# Altium schematic sheet FPGA_Banks_and_Filters.SchDoc
size A4; SheetNumber: 10; SheetTotal: 13
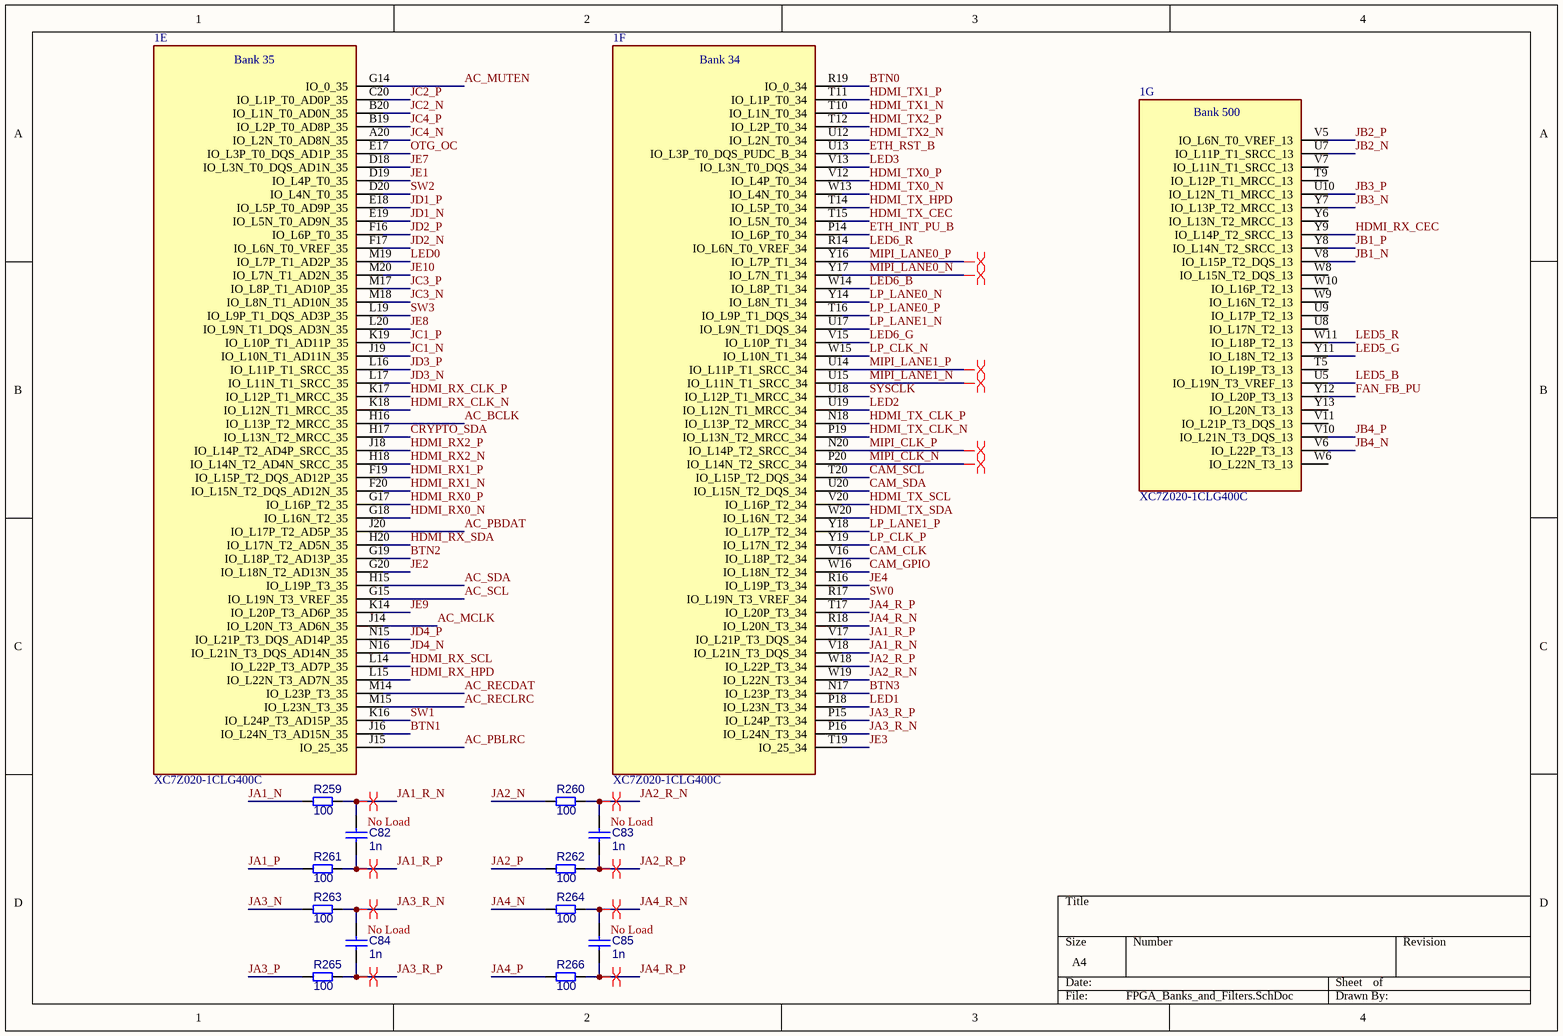
[diagram p0: FPGA_Banks_and_Filters.SchDoc]

## Parts
1  XC7Z020-1CLG400C  [BGA400C80P20X20_1700X1700X160]  (parts E,F,G of 9)
C82  1n  [CAPC1005X50N_0402]
C83  1n  [CAPC1005X50N_0402]
C84  1n  [CAPC1005X50N_0402]
C85  1n  [CAPC1005X50N_0402]
R259  100  [R_0402]
R260  100  [R_0402]
R261  100  [R_0402]
R262  100  [R_0402]
R263  100  [R_0402]
R264  100  [R_0402]
R265  100  [R_0402]
R266  100  [R_0402]

## Nets
AC_BCLK: 1.H16(IO_L13P_T2_MRCC_35)
AC_MCLK: 1.J14(IO_L20N_T3_AD6N_35)
AC_MUTEN: 1.G14(IO_0_35)
AC_PBDAT: 1.J20(IO_L17P_T2_AD5P_35)
AC_PBLRC: 1.J15(IO_25_35)
AC_RECDAT: 1.M14(IO_L23P_T3_35)
AC_RECLRC: 1.M15(IO_L23N_T3_35)
AC_SCL: 1.G15(IO_L19N_T3_VREF_35)
AC_SDA: 1.H15(IO_L19P_T3_35)
BTN0: 1.R19(IO_0_34)
BTN1: 1.J16(IO_L24N_T3_AD15N_35)
BTN2: 1.G19(IO_L18P_T2_AD13P_35)
BTN3: 1.N17(IO_L23P_T3_34)
CAM_CLK: 1.V16(IO_L18P_T2_34)
CAM_GPIO: 1.W16(IO_L18N_T2_34)
CAM_SCL: 1.T20(IO_L15P_T2_DQS_34)
CAM_SDA: 1.U20(IO_L15N_T2_DQS_34)
CRYPTO_SDA: 1.H17(IO_L13N_T2_MRCC_35)
ETH_INT_PU_B: 1.P14(IO_L6P_T0_34)
ETH_RST_B: 1.U13(IO_L3P_T0_DQS_PUDC_B_34)
FAN_FB_PU: 1.Y12(IO_L20P_T3_13)
HDMI_RX0_N: 1.G18(IO_L16N_T2_35)
HDMI_RX0_P: 1.G17(IO_L16P_T2_35)
HDMI_RX1_N: 1.F20(IO_L15N_T2_DQS_AD12N_35)
HDMI_RX1_P: 1.F19(IO_L15P_T2_DQS_AD12P_35)
HDMI_RX2_N: 1.H18(IO_L14N_T2_AD4N_SRCC_35)
HDMI_RX2_P: 1.J18(IO_L14P_T2_AD4P_SRCC_35)
HDMI_RX_CEC: 1.Y9(IO_L14P_T2_SRCC_13)
HDMI_RX_CLK_N: 1.K18(IO_L12N_T1_MRCC_35)
HDMI_RX_CLK_P: 1.K17(IO_L12P_T1_MRCC_35)
HDMI_RX_HPD: 1.L15(IO_L22N_T3_AD7N_35)
HDMI_RX_SCL: 1.L14(IO_L22P_T3_AD7P_35)
HDMI_RX_SDA: 1.H20(IO_L17N_T2_AD5N_35)
HDMI_TX0_N: 1.W13(IO_L4N_T0_34)
HDMI_TX0_P: 1.V12(IO_L4P_T0_34)
HDMI_TX1_N: 1.T10(IO_L1N_T0_34)
HDMI_TX1_P: 1.T11(IO_L1P_T0_34)
HDMI_TX2_N: 1.U12(IO_L2N_T0_34)
HDMI_TX2_P: 1.T12(IO_L2P_T0_34)
HDMI_TX_CEC: 1.T15(IO_L5N_T0_34)
HDMI_TX_CLK_N: 1.P19(IO_L13N_T2_MRCC_34)
HDMI_TX_CLK_P: 1.N18(IO_L13P_T2_MRCC_34)
HDMI_TX_HPD: 1.T14(IO_L5P_T0_34)
HDMI_TX_SCL: 1.V20(IO_L16P_T2_34)
HDMI_TX_SDA: 1.W20(IO_L16N_T2_34)
JA1_N: R259.1
JA1_P: R261.1
JA1_R_N: 1.V18(IO_L21N_T3_DQS_34) C82.2 R259.2
JA1_R_P: 1.V17(IO_L21P_T3_DQS_34) C82.1 R261.2
JA2_N: R260.1
JA2_P: R262.1
JA2_R_N: 1.W19(IO_L22N_T3_34) C83.2 R260.2
JA2_R_P: 1.W18(IO_L22P_T3_34) C83.1 R262.2
JA3_N: R263.1
JA3_P: R265.1
JA3_R_N: 1.P16(IO_L24N_T3_34) C84.2 R263.2
JA3_R_P: 1.P15(IO_L24P_T3_34) C84.1 R265.2
JA4_N: R264.1
JA4_P: R266.1
JA4_R_N: 1.R18(IO_L20N_T3_34) C85.2 R264.2
JA4_R_P: 1.T17(IO_L20P_T3_34) C85.1 R266.2
JB1_N: 1.V8(IO_L15P_T2_DQS_13)
JB1_P: 1.Y8(IO_L14N_T2_SRCC_13)
JB2_N: 1.U7(IO_L11P_T1_SRCC_13)
JB2_P: 1.V5(IO_L6N_T0_VREF_13)
JB3_N: 1.Y7(IO_L13P_T2_MRCC_13)
JB3_P: 1.U10(IO_L12N_T1_MRCC_13)
JB4_N: 1.V6(IO_L22P_T3_13)
JB4_P: 1.V10(IO_L21N_T3_DQS_13)
JC1_N: 1.J19(IO_L10N_T1_AD11N_35)
JC1_P: 1.K19(IO_L10P_T1_AD11P_35)
JC2_N: 1.B20(IO_L1N_T0_AD0N_35)
JC2_P: 1.C20(IO_L1P_T0_AD0P_35)
JC3_N: 1.M18(IO_L8N_T1_AD10N_35)
JC3_P: 1.M17(IO_L8P_T1_AD10P_35)
JC4_N: 1.A20(IO_L2N_T0_AD8N_35)
JC4_P: 1.B19(IO_L2P_T0_AD8P_35)
JD1_N: 1.E19(IO_L5N_T0_AD9N_35)
JD1_P: 1.E18(IO_L5P_T0_AD9P_35)
JD2_N: 1.F17(IO_L6N_T0_VREF_35)
JD2_P: 1.F16(IO_L6P_T0_35)
JD3_N: 1.L17(IO_L11N_T1_SRCC_35)
JD3_P: 1.L16(IO_L11P_T1_SRCC_35)
JD4_N: 1.N16(IO_L21N_T3_DQS_AD14N_35)
JD4_P: 1.N15(IO_L21P_T3_DQS_AD14P_35)
JE1: 1.D19(IO_L4P_T0_35)
JE2: 1.G20(IO_L18N_T2_AD13N_35)
JE3: 1.T19(IO_25_34)
JE4: 1.R16(IO_L19P_T3_34)
JE7: 1.D18(IO_L3N_T0_DQS_AD1N_35)
JE8: 1.L20(IO_L9N_T1_DQS_AD3N_35)
JE9: 1.K14(IO_L20P_T3_AD6P_35)
JE10: 1.M20(IO_L7N_T1_AD2N_35)
LED0: 1.M19(IO_L7P_T1_AD2P_35)
LED1: 1.P18(IO_L23N_T3_34)
LED2: 1.U19(IO_L12N_T1_MRCC_34)
LED3: 1.V13(IO_L3N_T0_DQS_34)
LED5_B: 1.U5(IO_L19N_T3_VREF_13)
LED5_G: 1.Y11(IO_L18N_T2_13)
LED5_R: 1.W11(IO_L18P_T2_13)
LED6_B: 1.W14(IO_L8P_T1_34)
LED6_G: 1.V15(IO_L10P_T1_34)
LED6_R: 1.R14(IO_L6N_T0_VREF_34)
LP_CLK_N: 1.W15(IO_L10N_T1_34)
LP_CLK_P: 1.Y19(IO_L17N_T2_34)
LP_LANE0_N: 1.Y14(IO_L8N_T1_34)
LP_LANE0_P: 1.T16(IO_L9P_T1_DQS_34)
LP_LANE1_N: 1.U17(IO_L9N_T1_DQS_34)
LP_LANE1_P: 1.Y18(IO_L17P_T2_34)
MIPI_CLK_N: 1.P20(IO_L14N_T2_SRCC_34)
MIPI_CLK_P: 1.N20(IO_L14P_T2_SRCC_34)
MIPI_LANE0_N: 1.Y17(IO_L7N_T1_34)
MIPI_LANE0_P: 1.Y16(IO_L7P_T1_34)
MIPI_LANE1_N: 1.U15(IO_L11N_T1_SRCC_34)
MIPI_LANE1_P: 1.U14(IO_L11P_T1_SRCC_34)
OTG_OC: 1.E17(IO_L3P_T0_DQS_AD1P_35)
SW0: 1.R17(IO_L19N_T3_VREF_34)
SW1: 1.K16(IO_L24P_T3_AD15P_35)
SW2: 1.D20(IO_L4N_T0_35)
SW3: 1.L19(IO_L9P_T1_DQS_AD3P_35)
SYSCLK: 1.U18(IO_L12P_T1_MRCC_34)

Not connected (* = marked no-connect by the designer): 1 T5(IO_L19P_T3_13) T9(IO_L12P_T1_MRCC_13) U8(IO_L17N_T2_13) U9(IO_L17P_T2_13) V7(IO_L11N_T1_SRCC_13) V11(IO_L21P_T3_DQS_13) W6(IO_L22N_T3_13) W8(IO_L15N_T2_DQS_13) W9(IO_L16N_T2_13) W10(IO_L16P_T2_13) Y6(IO_L13N_T2_MRCC_13) Y13(IO_L20N_T3_13)

## Layout directives
differential pair: JA1_R_N, JA1_R_P, JA2_R_N, JA2_R_P, JA3_R_N, JA3_R_P, JA4_R_N, JA4_R_P, MIPI_CLK_N, MIPI_CLK_P, MIPI_LANE0_N, MIPI_LANE0_P, MIPI_LANE1_N, MIPI_LANE1_P

## Notes on the sheet
- (near C82) No Load
- (near C83) No Load
- (near C84) No Load
- (near C85) No Load
- (in symbol XC7Z020-1CLG400C, part E) Bank 35
- (in symbol XC7Z020-1CLG400C, part F) Bank 34
- (in symbol XC7Z020-1CLG400C, part G) Bank 500

## Library data of the parts
1 = XC7Z020-1CLG400C: Integrated Circuit; Manufacturer_Name: AMD; Datasheet Link: http://www.xilinx.com/support/documentation/data_sheets/ds190-Zynq-7000-Overview.pdf; Height: 1.6mm; Manufacturer_Part_Number: XC7Z020-1CLG400C; Mouser Part Number: 217-XC7Z020-1CLG400C; Mouser Price/Stock: https://www.mouser.co.uk/ProductDetail/AMD-Xilinx/XC7Z020-1CLG400C?qs=rrS6PyfT74eaxuOsP%2FGL4g%3D%3D
C82-C85 = CMP-001-00084-2: MLCC 0402
R259-R266 = CMP-009-00178-3: Chip 0402 resistor